# Altium project buoy_controller_board.PrjPcb
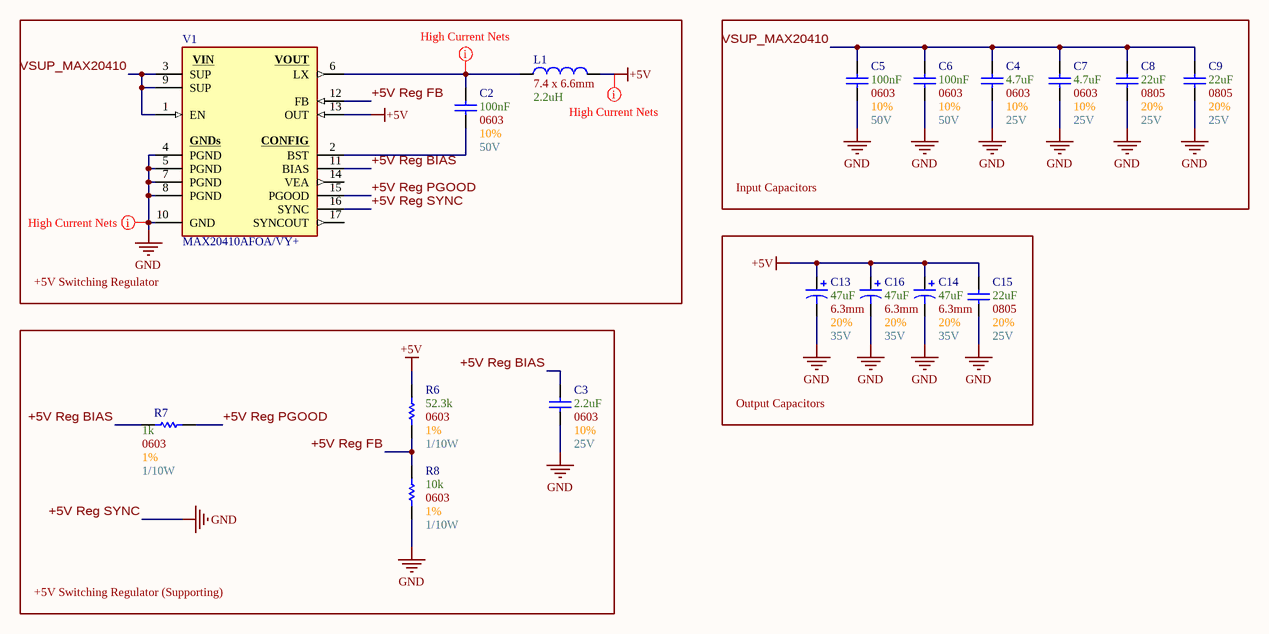
[diagram p0: Power.SchDoc]
4 sheets, 56 parts. Net scope: global (net labels, ports and power ports of the same name join across sheets).
Board file: buoy_controller_v1.PcbDoc
Sheets:
  Power.SchDoc
  E-Fuse.SchDoc
  LoRa and Pico.SchDoc
  Connectors.SchDoc

## Sheet Power.SchDoc
size A4; SheetNumber: 1; SheetTotal: 4

### Parts
C2  Max Voltage: 50V  Size Package: 0603  Tolerance: 10%  Capacitance: 100nF  [[Cap] SMD 0603]  (hidden comment: [Cap] 0603 0.1uF 10% 50V)
C3  Max Voltage: 25V  Size Package: 0603  Tolerance: 10%  Capacitance: 2.2uF  [[Cap] SMD 0603]  (hidden comment: [Cap] 0603 2.2uF 10% 25V)
C4  Max Voltage: 25V  Size Package: 0603  Tolerance: 10%  Capacitance: 4.7uF  [[Cap] SMD 0603]  (hidden comment: [Cap] 0603 4.7uF 10% 25V)
C5  Max Voltage: 50V  Size Package: 0603  Tolerance: 10%  Capacitance: 100nF  [[Cap] SMD 0603]  (hidden comment: [Cap] 0603 0.1uF 10% 50V)
C6  Max Voltage: 50V  Size Package: 0603  Tolerance: 10%  Capacitance: 100nF  [[Cap] SMD 0603]  (hidden comment: [Cap] 0603 0.1uF 10% 50V)
C7  Max Voltage: 25V  Size Package: 0603  Tolerance: 10%  Capacitance: 4.7uF  [[Cap] SMD 0603]  (hidden comment: [Cap] 0603 4.7uF 10% 25V)
C8  Max Voltage: 25V  Size Package: 0805  Tolerance: 20%  Capacitance: 22uF  [[Cap] SMD 0805]  (hidden comment: [Cap] 0805 22uF 20% 25V)
C9  Max Voltage: 25V  Size Package: 0805  Tolerance: 20%  Capacitance: 22uF  [[Cap] SMD 0805]  (hidden comment: [Cap] 0805 22uF 20% 25V)
C13  Max Voltage: 35V  Size Package: 6.3mm  Tolerance: 20%  Capacitance: 47uF  [[Cap] SMD Polarized, 6.3mm]  (hidden comment: [Cap] 6.3mm 47uF 20% 35V)
C14  Max Voltage: 35V  Size Package: 6.3mm  Tolerance: 20%  Capacitance: 47uF  [[Cap] SMD Polarized, 6.3mm]  (hidden comment: [Cap] 6.3mm 47uF 20% 35V)
C15  Max Voltage: 25V  Size Package: 0805  Tolerance: 20%  Capacitance: 22uF  [[Cap] SMD 0805]  (hidden comment: [Cap] 0805 22uF 20% 25V)
C16  Max Voltage: 35V  Size Package: 6.3mm  Tolerance: 20%  Capacitance: 47uF  [[Cap] SMD Polarized, 6.3mm]  (hidden comment: [Cap] 6.3mm 47uF 20% 35V)
L1  Package: 7.4 x 6.6mm  Inductance: 2.2uH  [[Inductor] SMD 7.4 X 6.6 X 3 MM]  (hidden comment: [2.2uH] SMD Nonstandard 10A)
R6  Wattage: 1/10W  Tolerance: 1%  Resistance: 52.3k  Size Package: 0603  [[Res] SMD 0603]  (hidden comment: [52.3k] SMD 0603 1% 1/10W)
R7  Wattage: 1/10W  Tolerance: 1%  Resistance: 1k  Size Package: 0603  [[Res] SMD 0603]  (hidden comment: [1k] SMD 0603 1% 1/10W)
R8  Wattage: 1/10W  Tolerance: 1%  Resistance: 10k  Size Package: 0603  [[Res] SMD 0603]  (hidden comment: [10k] SMD 0603 1% 1/10W)
V1  MAX20410AFOA/VY+  [[Switching] 17-PowerWFQFN]

### Blocks framed on the sheet
+5V Switching Regulator: C2 L1 V1
Input Capacitors: C4-C9
Output Capacitors: C13-C16
+5V Switching Regulator (Supporting): C3 R6-R8

### Nets
+5V: C13.1 C14.1 C15.2 C16.1 L1.2 R6.2 V1.13(OUT)
GND: C3.1 C4.1 C5.1 C6.1 C7.1 C8.1 C9.1 C13.2 C14.2 C15.1 C16.2 R8.1 V1.4(PGND) V1.5(PGND) V1.7(PGND) V1.8(PGND) V1.10(GND) V1.16(SYNC)  [also labelled +5V Reg SYNC]
+5V Reg BIAS: C3.2 R7.1 V1.11(BIAS)
+5V Reg FB: R6.1 R8.2 V1.12(FB)
+5V Reg PGOOD: R7.2 V1.15(PGOOD)
VSUP_MAX20410: C4.2 C5.2 C6.2 C7.2 C8.2 C9.2 V1.1(EN) V1.3(SUP) V1.9(SUP)
NetC2_1: C2.1 V1.2(BST)
NetC2_2: C2.2 L1.1 V1.6(LX)

Not connected (* = marked no-connect by the designer): V1 14(VEA) 17(SYNCOUT)

### Layout directives
net class High_Current_Nets: +5V, GND, NetC2_2

### Notes on the sheet
- Project/Vehicle:
- Author(s):
- -
- Revisor(s):
- Git Repo:
- Git Hash:
- Date:
- Revision:
- Size:
- A4
- File:
- Sheet
- of
- (in symbol [Switching] SMD 0.8-10V 10A) VIN; VOUT; GNDs; CONFIG

### Library data of the parts
C2 C5 C6 = [Cap] 0603 0.1uF 10% 50V: CL10B104KB8NNNC; Supplier 1: DigiKey; Supplier Part Number 1: 1276-1000-6-ND
C3 = [Cap] 0603 2.2uF 10% 25V: GRM188R61E225KA12D; Supplier 1: DigiKey; Supplier Part Number 1: 490-10731-1-ND
C4 C7 = [Cap] 0603 4.7uF 10% 25V: GRM188R61E475KE11D; Supplier 1: DigiKey; Supplier Part Number 1: 490-7203-6-ND
C8 C9 C15 = [Cap] 0805 22uF 20% 25V: CL21A226MAYNNWE; Supplier 1: DigiKey; Supplier Part Number 1: 1276-CL21A226MAYNNWECT-ND
C13 C14 C16 = [Cap] 6.3mm 47uF 20% 35V: UWT1V470MCL1GS; Supplier 1: DigiKey; Supplier Part Number 1: 493-2202-1-ND
L1 = [2.2uH] SMD Nonstandard 10A: ECS-MPIL0630-2R2MC; Supplier 1: DigiKey; Supplier Part Number 1: XC2402CT-ND
R6 = [52.3k] SMD 0603 1% 1/10W: RC0603FR-0752K3L; Supplier 1: DigiKey; Supplier Part Number 1: 311-52.3KHRCT-ND
R7 = [1k] SMD 0603 1% 1/10W: RMCF0603FT1K00; Supplier 1: DigiKey; Supplier Part Number 1: RMCF0603FT1K00DKR-ND
R8 = [10k] SMD 0603 1% 1/10W: RMCF0603FT10K0; Supplier 1: DigiKey; Supplier Part Number 1: RMCF0603FT10K0DKR-ND
V1 = [Switching] SMD 0.8-10V 10A: Supplier 1: DigiKey; Supplier Part Number 1: 505-MAX20410AFOA/VY+-ND

## Sheet E-Fuse.SchDoc
size A; SheetNumber: 2; SheetTotal: 4
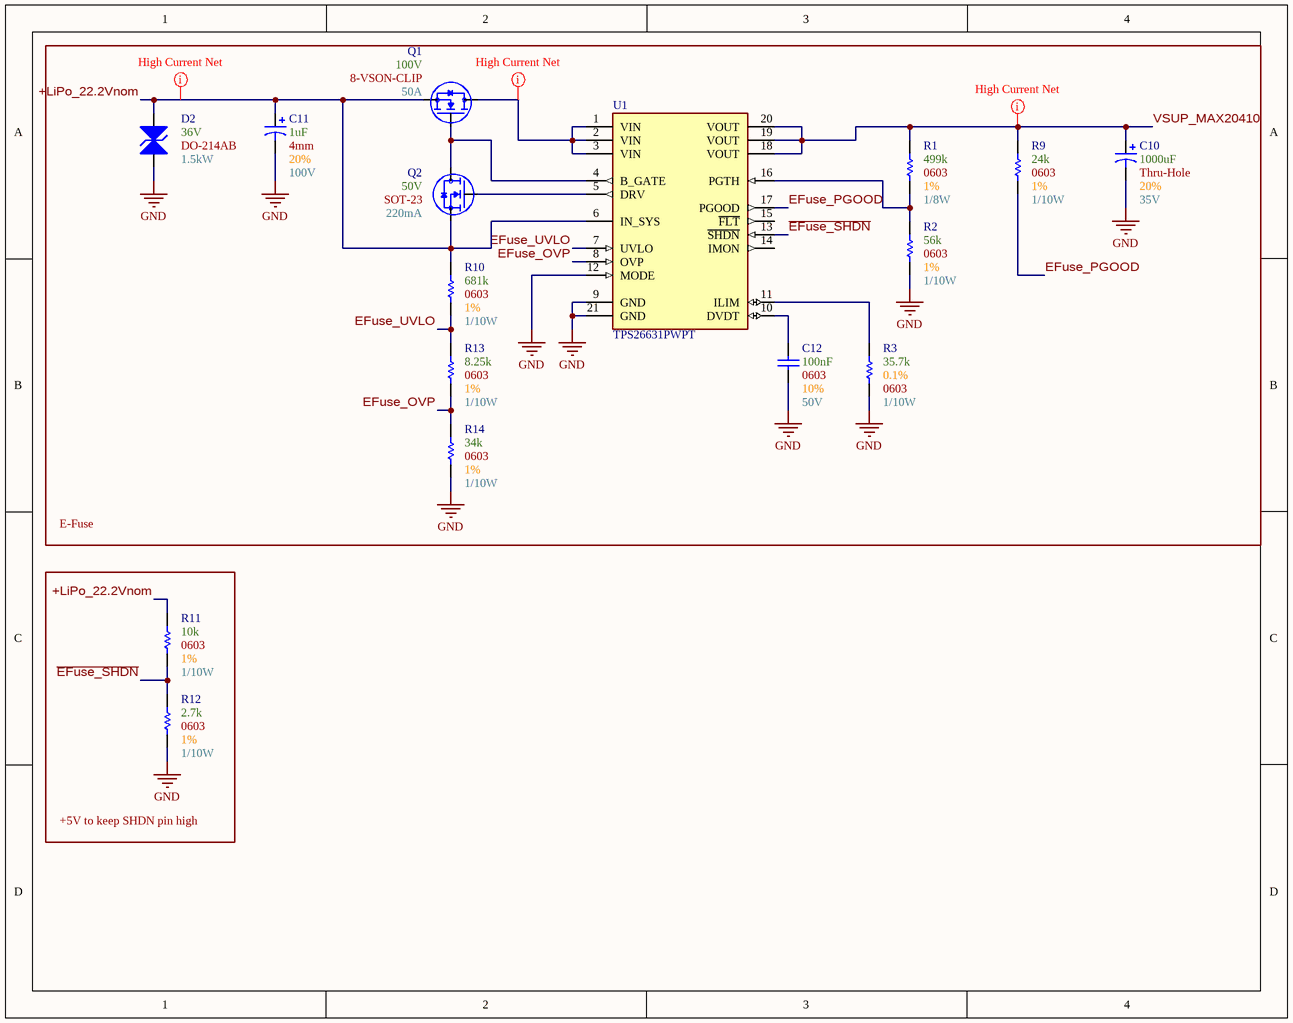
[diagram p1: E-Fuse.SchDoc]

### Parts
C10  Max Voltage: 35V  Size Package: Thru-Hole  Tolerance: 20%  Capacitance: 1000uF  [[Cap] Thru-Hole Polarized 10mm]  (hidden comment: [Cap] Thru-Hole 1000uF 20% 35V)
C11  Max Voltage: 100V  Size Package: 4mm  Tolerance: 20%  Capacitance: 1uF  [[Cap] SMD Polarized, 4mm]  (hidden comment: [Cap] 4mm 1uF 20% 100V)
C12  Max Voltage: 50V  Size Package: 0603  Tolerance: 10%  Capacitance: 100nF  [[Cap] SMD 0603]  (hidden comment: [Cap] 0603 0.1uF 10% 50V)
D2  Wattage: 1.5kW  Optimal Zener Voltage: 36V  [[Diode] SMD DO-214AB]  (hidden comment: DO-214AB)
Q1  IDS_Max: 50A  VDS_Max: 100V  [8-VSON-CLIP]  (hidden comment: CSD19537Q3)
Q2  IDS_Max: 220mA  VDS_Max: 50V  [SOT-23]  (hidden comment: [NMOS] SMD 50V 220mA 3Ohm)
R1  Wattage: 1/8W  Tolerance: 1%  Resistance: 499k  Size Package: 0603  [[Res] SMD 0603]  (hidden comment: [499k] SMD 0603 1% 1/8W)
R2  Wattage: 1/10W  Tolerance: 1%  Resistance: 56k  Size Package: 0603  [[Res] SMD 0603]  (hidden comment: [56k] SMD 0603 1% 1/10W)
R3  Wattage: 1/10W  Tolerance: 0.1%  Resistance: 35.7k  Size Package: 0603  [[Res] SMD 0603]  (hidden comment: [35.7k] SMD 0603 0.1% 1/10W)
R9  Wattage: 1/10W  Tolerance: 1%  Resistance: 24k  Size Package: 0603  [[Res] SMD 0603]  (hidden comment: [24k] SMD 0603 1% 1/10W)
R10  Wattage: 1/10W  Tolerance: 1%  Resistance: 681k  Size Package: 0603  [[Res] SMD 0603]  (hidden comment: [681k] SMD 0603 1% 1/10W)
R11  Wattage: 1/10W  Tolerance: 1%  Resistance: 10k  Size Package: 0603  [[Res] SMD 0603]  (hidden comment: [10k] SMD 0603 1% 1/10W)
R12  Wattage: 1/10W  Tolerance: 1%  Resistance: 2.7k  Size Package: 0603  [[Res] SMD 0603]  (hidden comment: [2.7k] SMD 0603 1% 1/10W)
R13  Wattage: 1/10W  Tolerance: 1%  Resistance: 8.25k  Size Package: 0603  [[Res] SMD 0603]  (hidden comment: [8.25k] SMD 0603 1% 1/10W)
R14  Wattage: 1/10W  Tolerance: 1%  Resistance: 34k  Size Package: 0603  [[Res] SMD 0603]  (hidden comment: [34k] SMD 0603 1% 1/10W)
U1  TPS26631PWPT  [[E-Fuse] 4.5-60V 6A]

### Blocks framed on the sheet
E-Fuse: C10-C12 D2 Q1 Q2 R1-R3 R9 R10 R13 R14 U1
+5V to keep SHDN pin high: R11 R12

### Nets
GND: C10.2 C11.2 C12.1 D2.2(A) R2.1 R3.1 R12.1 R14.1 U1.9(GND) U1.12(MODE) U1.21(GND)
+LiPo_22.2Vnom: C11.1 D2.1(K) Q1.2(Source) Q2.2(Source) R10.2 R11.2 U1.6(IN_SYS)
~{EFuse_SHDN}: R11.1 R12.2 U1.13(~{SHDN})
EFuse_OVP: R13.1 R14.2 U1.8(OVP)
EFuse_PGOOD: R9.1 U1.17(PGOOD)
EFuse_UVLO: R10.1 R13.2 U1.7(UVLO)
VSUP_MAX20410: C10.1 R1.2 R9.2 U1.18(VOUT) U1.19(VOUT) U1.20(VOUT)
NetC12_2: C12.2 U1.10(DVDT)
NetQ1_1: Q1.1(Gate) Q2.3(Drain) U1.4(B_GATE)
NetQ1_3: Q1.3(Drain) U1.1(VIN) U1.2(VIN) U1.3(VIN)
NetQ2_1: Q2.1(Gate) U1.5(DRV)
NetR1_1: R1.1 R2.2 U1.16(PGTH)
NetR3_2: R3.2 U1.11(ILIM)

Not connected (* = marked no-connect by the designer): U1 14(IMON) 15(~{FLT})

### Layout directives
net class High_Current_Nets: +LiPo_22.2Vnom, NetQ1_3, VSUP_MAX20410

### Library data of the parts
C10 = [Cap] Thru-Hole 1000uF 20% 35V: 35PK1000MEFC10X20; Supplier 1: DigiKey; Supplier Part Number 1: 1189-1742-ND
C11 = [Cap] 4mm 1uF 20% 100V: 865080840001; Supplier 1: DigiKey; Supplier Part Number 1: 732-865080840001CT-ND
C12 = [Cap] 0603 0.1uF 10% 50V: CL10B104KB8NNNC; Supplier 1: DigiKey; Supplier Part Number 1: 1276-1000-6-ND
D2 = [TVS] 36Vnom 40Vclamp_max: SMCJ36CA; Supplier 1: DigiKey; Supplier Part Number 1: SMCJ36CALFDKR-ND; Footprint: DO-214AB
Q1 = [NMOS] SMD 100V 50A 14.5mOhm: Supplier 1: DigiKey; Supplier Part Number 1: 296-44351-6-ND; Package: 8-VSON-CLIP
Q2 = [NMOS] SMD 50V 220mA 3Ohm: BSS138; Supplier 1: DigiKey; Supplier Part Number 1: BSS138DKR-ND; Package: SOT-23
R1 = [499k] SMD 0603 1% 1/8W: CRCW0603499KFKEA; Supplier 1: DigiKey; Supplier Part Number 1: 541-499KHDKR-ND
R2 = [56k] SMD 0603 1% 1/10W: CRGCQ0603F56K; Supplier 1: DigiKey; Supplier Part Number 1: A129709CT-ND
R3 = [35.7k] SMD 0603 0.1% 1/10W: RT0603BRE0735K7L; Supplier 1: DigiKey; Supplier Part Number 1: YAG4707CT-ND
R9 = [24k] SMD 0603 1% 1/10W: RC0603FR-1324KL; Supplier 1: DigiKey; Supplier Part Number 1: 13-RC0603FR-1324KLCT-ND
R10 = [681k] SMD 0603 1% 1/10W: RT0603FRE07681KL; Supplier 1: DigiKey; Supplier Part Number 1: 13-RT0603FRE07681KLCT-ND
R11 = [10k] SMD 0603 1% 1/10W: RMCF0603FT10K0; Supplier 1: DigiKey; Supplier Part Number 1: RMCF0603FT10K0DKR-ND
R12 = [2.7k] SMD 0603 1% 1/10W: AC0603FR-072K7L; Supplier 1: DigiKey; Supplier Part Number 1: YAG3589CT-ND
R13 = [8.25k] SMD 0603 1% 1/10W: AF0603FR-078K25L; Supplier 1: DigiKey; Supplier Part Number 1: 13-AF0603FR-078K25LCT-ND
R14 = [34k] SMD 0603 1% 1/10W: RC0603FR-1334KL; Supplier 1: DigiKey; Supplier Part Number 1: 13-RC0603FR-1334KLDKR-ND
U1 = [E-Fuse] 4.5-60V 6A

## Sheet LoRa and Pico.SchDoc
size B; SheetNumber: 3; SheetTotal: 4
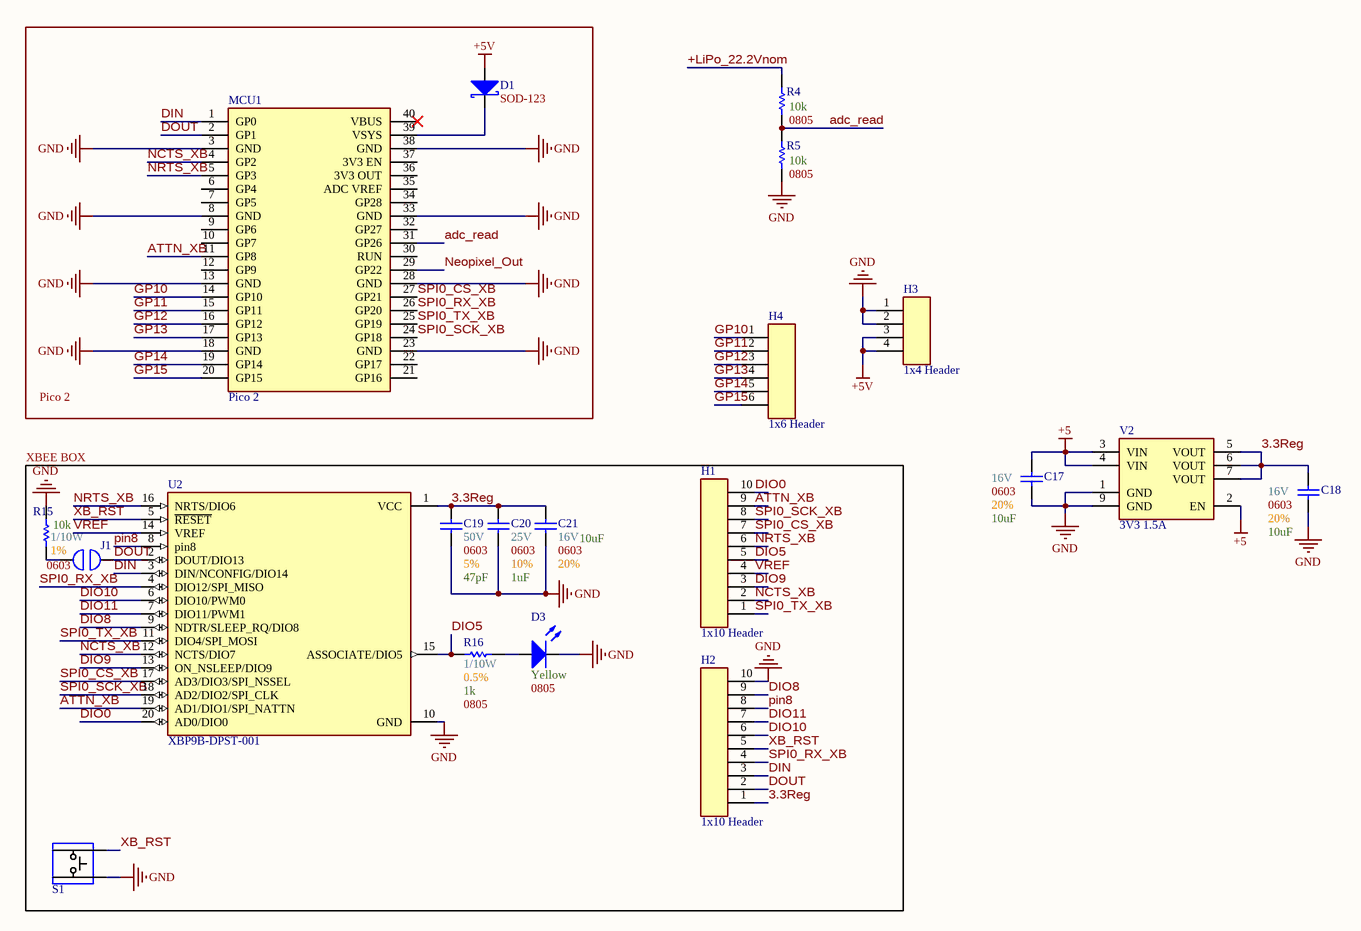
[diagram p2: LoRa and Pico.SchDoc]

### Parts
C17  Max Voltage: 16V  Size Package: 0603  Tolerance: 20%  Capacitance: 10uF  [[Cap] SMD 0603]  (hidden comment: [Cap] 0603 10uF 20% 16V)
C18  Max Voltage: 16V  Size Package: 0603  Tolerance: 20%  Capacitance: 10uF  [[Cap] SMD 0603]  (hidden comment: [Cap] 0603 10uF 20% 16V)
C19  Max Voltage: 50V  Size Package: 0603  Tolerance: 5%  Capacitance: 47pF  [[Cap] SMD 0603]  (hidden comment: [Cap] 0603 47pF 5% 50V)
C20  Max Voltage: 25V  Size Package: 0603  Tolerance: 10%  Capacitance: 1uF  [[Cap] SMD 0603]  (hidden comment: [Cap] 0603 1uF 10% 25V)
C21  Max Voltage: 16V  Size Package: 0603  Tolerance: 20%  Capacitance: 10uF  [[Cap] SMD 0603]  (hidden comment: [Cap] 0603 10uF 20% 16V)
D1  Footprint: SOD-123  [[Diode] SMD SOD-123]  (hidden comment: SOD123)
D3  Color: Yellow  Size Package: 0805  [[LED] SMD 0805]  (hidden comment: [LED] SMD 0805 Yellow)
H1  1x10 Header  [[Header] 1x10 Male]
H2  1x10 Header  [[Header] 1x10 Male]
H3  1x4 Header  [[Header] 1x4 Male]
H4  1x6 Header  [[Header] 1x6 Male]
J1  [Jumper] Thru-Hole 2pin  [[Jumper] Thru-Hole 2pin]  (value not drawn)
MCU1  Pico 2  [[Pi] Pico 2]
R4  Resistance: 10k  Size Package: 0805  [[Res] SMD 0805]  (hidden comment: [10k] SMD 0805 5% 1/8W)
R5  Resistance: 10k  Size Package: 0805  [[Res] SMD 0805]  (hidden comment: [10k] SMD 0805 5% 1/8W)
R15  Wattage: 1/10W  Tolerance: 1%  Resistance: 10k  Size Package: 0603  [[Res] SMD 0603]  (hidden comment: [10k] SMD 0603 1% 1/10W)
R16  Wattage: 1/10W  Tolerance: 0.5%  Resistance: 1k  Size Package: 0805  [[Res] SMD 0805]  (hidden comment: [1k] SMD 0805 0.5% 1/10W)
S1  Standard pushbutton  [[SPST] Pushbutton]  (value not drawn)
U2  XBP9B-DPST-001  [xbee]
V2  3V3 1.5A  [[Linear] 3V3 1.5A]

### Blocks framed on the sheet
Pico 2: D1 MCU1
XBEE BOX: C19-C21 D3 H1 H2 J1 R15 R16 S1 U2

### Nets
+5: C17.2 V2.2(EN) V2.3(VIN) V2.4(VIN)
+5V: D1.2(A) H3.3 H3.4
GND: C17.1 C18.1 C19.1 C20.1 C21.1 D3.2(Cathode) H2.10 H3.1 H3.2 MCU1.3(GND) MCU1.8(GND) MCU1.13(GND) MCU1.18(GND) MCU1.23(GND) MCU1.28(GND) MCU1.33(GND) MCU1.38(GND) R5.1 R15.1 S1.1 U2.10(GND) V2.1(GND) V2.9(GND)
3.3Reg: C18.2 C19.2 C20.2 C21.2 H2.1 U2.1(VCC) V2.5(VOUT) V2.6(VOUT) V2.7(VOUT)
+LiPo_22.2Vnom: R4.2
adc_read: MCU1.31(GP26) R4.1 R5.2
ATTN_XB: H1.9 MCU1.11(GP8) U2.19(AD1/DIO1/SPI_NATTN)
DIN: H2.3 MCU1.1(GP0) U2.3(DIN/NCONFIG/DIO14)
DIO0: H1.10 U2.20(AD0/DIO0)
DIO5: H1.5 R16.1 U2.15(ASSOCIATE/DIO5)
DIO8: H2.9 U2.9(NDTR/SLEEP_RQ/DIO8)
DIO9: H1.3 U2.13(ON_NSLEEP/DIO9)
DIO10: H2.6 U2.6(DIO10/PWM0)
DIO11: H2.7 U2.7(DIO11/PWM1)
DOUT: H2.2 J1.2 MCU1.2(GP1) U2.2(DOUT/DIO13)
GP10: H4.1 MCU1.14(GP10)
GP11: H4.2 MCU1.15(GP11)
GP12: H4.3 MCU1.16(GP12)
GP13: H4.4 MCU1.17(GP13)
GP14: H4.5 MCU1.19(GP14)
GP15: H4.6 MCU1.20(GP15)
NCTS_XB: H1.2 MCU1.4(GP2) U2.12(NCTS/DIO7)
Neopixel_Out: MCU1.29(GP22)
NRTS_XB: H1.6 MCU1.5(GP3) U2.16(NRTS/DIO6)
pin8: H2.8 U2.8(pin8)
SPI0_CS_XB: H1.7 MCU1.27(GP21) U2.17(AD3/DIO3/SPI_NSSEL)
SPI0_RX_XB: H2.4 MCU1.26(GP20) U2.4(DIO12/SPI_MISO)
SPI0_SCK_XB: H1.8 MCU1.24(GP18) U2.18(AD2/DIO2/SPI_CLK)
SPI0_TX_XB: H1.1 MCU1.25(GP19) U2.11(DIO4/SPI_MOSI)
VREF: H1.4 U2.14(VREF)
XB_RST: H2.5 S1.2 U2.5(~{RESET})
NetD1_1: D1.1(K) MCU1.39(VSYS)
NetD3_1: D3.1(Anode) R16.2
NetJ1_1: J1.1 R15.2

Not connected (* = marked no-connect by the designer): MCU1 6(GP4) 7(GP5) 9(GP6) 10(GP7) 12(GP9) 21(GP16) 22(GP17) 30(RUN) 32(GP27) 34(GP28) 35(ADC_VREF) 36(3V3_OUT) 37(3V3_EN) 40(VBUS)*

### Library data of the parts
C17 C18 C21 = [Cap] 0603 10uF 20% 16V: GRM188C81C106MA73D; Supplier 1: DigiKey; Supplier Part Number 1: 490-7198-1-ND
C19 = [Cap] 0603 47pF 5% 50V: CL10C470JB8NNNC; Supplier 1: DigiKey; Supplier Part Number 1: 1276-1037-6-ND
C20 = [Cap] 0603 1uF 10% 25V: CL10B105KA8NNNC; Supplier 1: DigiKey; Supplier Part Number 1: 1276-1184-1-ND
D1 = [Schottky] SMD 40V 1A: B5819W-TP; Supplier 1: DigiKey; Supplier Part Number 1: B5819W-TPMSCT-ND
D3 = [LED] SMD 0805 Yellow: LY R976-PS-36-0-20-R18; Supplier 1: DigiKey; Supplier Part Number 1: 475-LYR976-PS-36-0-20-R18CT-ND
H1 H2 = [Header] 1x10 Male: 2.54mm pitch
H3 = [Header] 1x4 Male: 2.54mm pitch
H4 = [Header] 1x6 Male: 2.54mm pitch
MCU1 = [Pi] Pico 2: SC1631; Supplier 1: DigiKey; Supplier Part Number 1: 2648-SC1631TR-ND
R4 R5 = [10k] SMD 0805 5% 1/8W: RC0603FR-0710KL; Wattage: 1/10W; Supplier 1: DigiKey; Supplier Part Number 1: 311-10.0KHRDKR-ND; Tolerance: 5%
R15 = [10k] SMD 0603 1% 1/10W: RMCF0603FT10K0; Supplier 1: DigiKey; Supplier Part Number 1: RMCF0603FT10K0DKR-ND
R16 = [1k] SMD 0805 0.5% 1/10W: RR1220P-102-D; Supplier 1: DigiKey; Supplier Part Number 1: RR12P1.0KDCT-ND
S1 = [SPST] Pushbutton: Supplier 1: DigiKey; Supplier Part Number 1: 450-1650-ND
U2 = XBP9B-DPST-001: General ISM < 1GHz Transceiver Module 900MHz Antenna Not Included, RP-SMA Through Hole
V2 = [Linear] SMD 3V3 1.5A: AP7362A-33SP-13; Supplier 1: DigiKey; Supplier Part Number 1: AP7362A-33SP-13DICT-ND

## Sheet Connectors.SchDoc
size A; SheetNumber: 4; SheetTotal: 4
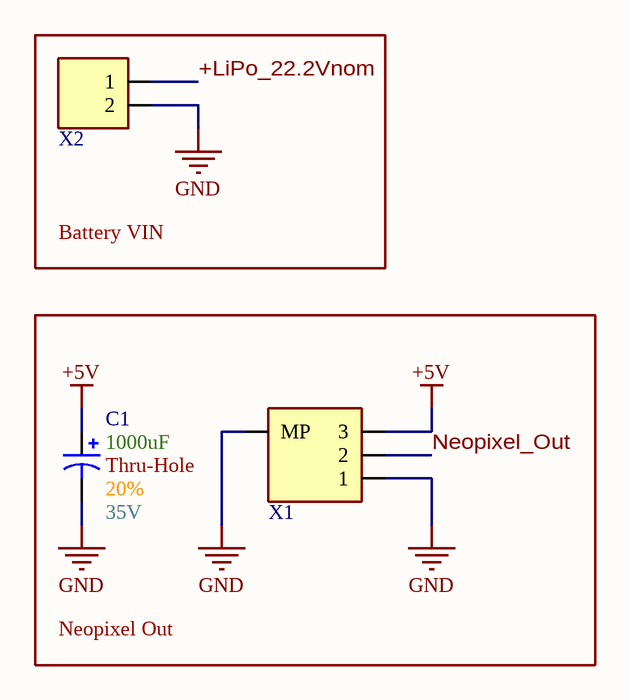
[diagram p3: Connectors.SchDoc]

### Parts
C1  Max Voltage: 35V  Size Package: Thru-Hole  Tolerance: 20%  Capacitance: 1000uF  [[Cap] Thru-Hole Polarized 10mm]  (hidden comment: [Cap] Thru-Hole 1000uF 20% 35V)
X1  [Pheonix] 3pin 2.5mm pitch  [[Pheonix] 3pin 2.5mm pitch]  (value not drawn)
X2  Anderson 2pos Right-Angle  [[Anderson] 2pos Right-Angle w/o MH 1327G17]  (value not drawn)

### Blocks framed on the sheet
Battery VIN: X2
Neopixel Out: C1 X1

### Nets
+5V: C1.1 X1.3
GND: C1.2 X1.1 X1.MP X2.2
+LiPo_22.2Vnom: X2.1
Neopixel_Out: X1.2

### Library data of the parts
C1 = [Cap] Thru-Hole 1000uF 20% 35V: 35PK1000MEFC10X20; Supplier 1: DigiKey; Supplier Part Number 1: 1189-1742-ND
X1 = [Pheonix] 3pin 2.5mm pitch: 1778777; Supplier 1: DigiKey; Supplier Part Number 1: 277-2316-1-ND
X2 = [Anderson] 2pos Right-Angle w/o MH

## Nets that join several sheets
+5V: Power (7 pins), LoRa and Pico (D1.2 H3.3 H3.4), Connectors (C1.1 X1.3)
GND: Power (18 pins), E-Fuse (11 pins), LoRa and Pico (23 pins), Connectors (C1.2 X1.1 X1.MP X2.2)
+LiPo_22.2Vnom: E-Fuse (7 pins), LoRa and Pico (R4.2), Connectors (X2.1)
Neopixel_Out: LoRa and Pico (MCU1.29), Connectors (X1.2)
VSUP_MAX20410: Power (9 pins), E-Fuse (6 pins)